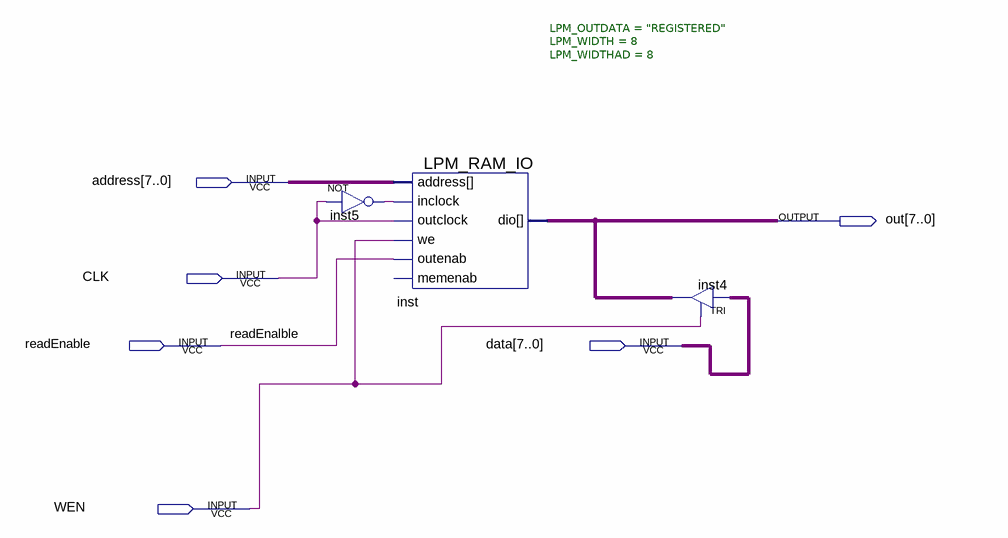
[diagram p0: schematic sheet]
// Quartus schematic DataMemory.bdf as structural Verilog: 3 symbols, 6 pins
module DataMemory (
  input  [7:0] address,
  input  CLK,
  input  readEnable,
  input  [7:0] data,
  input  WEN,
  output [7:0] out
);

  wire inst5_out;

  not inst5 (inst5_out, CLK);
  LPM_RAM_IO #(.LPM_OUTDATA("REGISTERED"), .LPM_WIDTH(8), .LPM_WIDTHAD(8)) inst (
    .address(address), .outclock(CLK), .inclock(inst5_out), .we(WEN), .outenab(readEnable), .dio(out));  // open: memenab
  TRI inst4[7:0] (.IN(data), .OE(WEN), .OUT(out));

  // Other names for the same wires on the sheet: readEnalble = readEnable
endmodule
